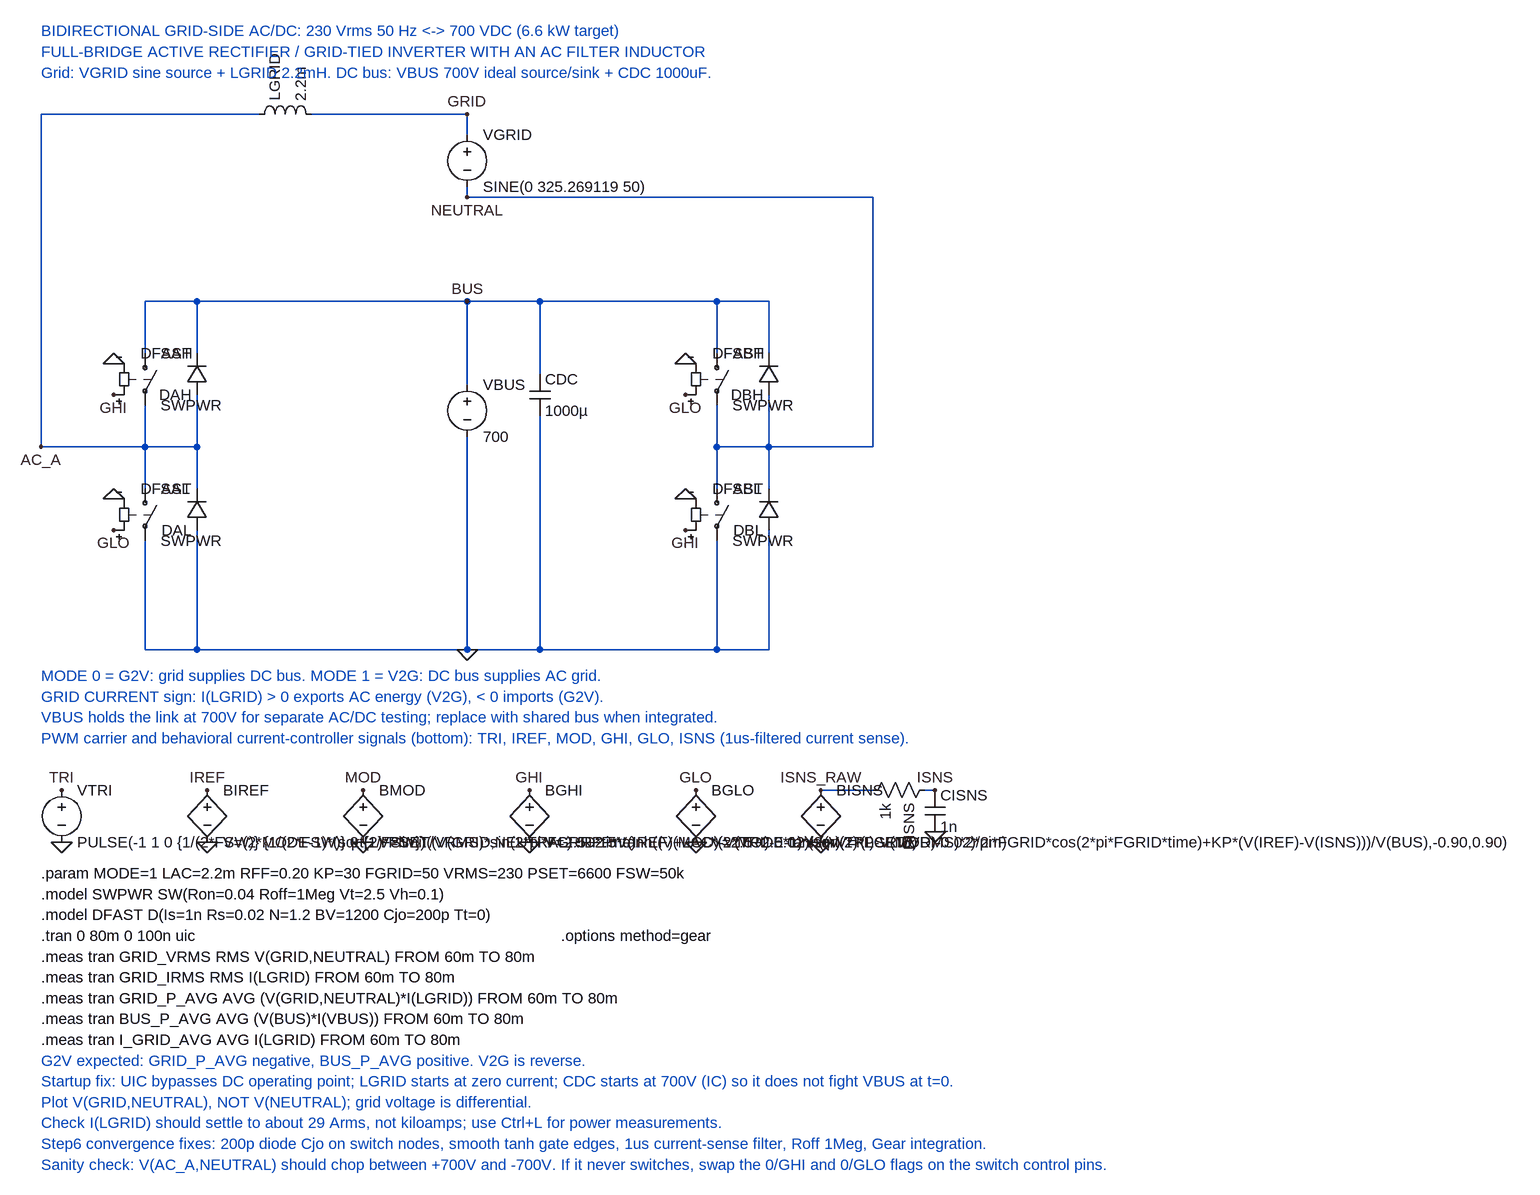
[diagram p0: schematic acdc_grid_stage.asc]
acdc_grid_stage.asc, the LTspice schematic file:
Version 4.1
SHEET 1 2856 2000
WIRE 736 176 400 176
WIRE 1056 176 816 176
WIRE 1056 208 1056 176
WIRE 1056 304 1056 288
WIRE 1680 304 1056 304
WIRE 640 464 560 464
WIRE 1056 464 640 464
WIRE 1168 464 1056 464
WIRE 1440 464 1168 464
WIRE 1520 464 1440 464
WIRE 560 544 560 464
WIRE 640 544 640 464
WIRE 1440 544 1440 464
WIRE 1520 544 1520 464
WIRE 1168 576 1168 464
WIRE 1056 592 1056 464
WIRE 400 688 400 176
WIRE 560 688 560 624
WIRE 560 688 400 688
WIRE 640 688 640 608
WIRE 640 688 560 688
WIRE 1440 688 1440 624
WIRE 1520 688 1520 608
WIRE 1520 688 1440 688
WIRE 1680 688 1680 304
WIRE 1680 688 1520 688
WIRE 560 752 560 688
WIRE 640 752 640 688
WIRE 1440 752 1440 688
WIRE 1520 752 1520 688
WIRE 560 1000 560 832
WIRE 640 1000 640 816
WIRE 640 1000 560 1000
WIRE 1056 1000 1056 672
WIRE 1056 1000 640 1000
WIRE 1168 1000 1168 640
WIRE 1168 1000 1056 1000
WIRE 1440 1000 1440 832
WIRE 1440 1000 1168 1000
WIRE 1520 1000 1520 816
WIRE 1520 1000 1440 1000
WIRE 1680 1216 1600 1216
WIRE 1776 1216 1760 1216
FLAG 1056 464 BUS
FLAG 400 688 AC_A
FLAG 1056 176 GRID
FLAG 1056 304 NEUTRAL
FLAG 1056 1000 0
FLAG 512 560 0
FLAG 512 608 GHI
FLAG 512 768 0
FLAG 512 816 GLO
FLAG 1392 560 0
FLAG 1392 608 GLO
FLAG 1392 768 0
FLAG 1392 816 GHI
FLAG 432 1216 TRI
FLAG 432 1296 0
FLAG 656 1216 IREF
FLAG 656 1296 0
FLAG 896 1216 MOD
FLAG 896 1296 0
FLAG 1152 1216 GHI
FLAG 1152 1296 0
FLAG 1408 1216 GLO
FLAG 1408 1296 0
FLAG 1600 1216 ISNS_RAW
FLAG 1600 1296 0
FLAG 1776 1216 ISNS
FLAG 1776 1280 0
SYMBOL ind 720 192 R270
SYMATTR InstName LGRID
SYMATTR Value 2.2m
SYMATTR SpiceLine Rser=0.12
SYMBOL voltage 1056 192 R0
SYMATTR InstName VGRID
SYMATTR Value SINE(0 325.269119 50)
SYMBOL sw 560 528 R0
SYMATTR InstName SAH
SYMATTR Value SWPWR
SYMBOL sw 560 736 R0
SYMATTR InstName SAL
SYMATTR Value SWPWR
SYMBOL sw 1440 528 R0
SYMATTR InstName SBH
SYMATTR Value SWPWR
SYMBOL sw 1440 736 R0
SYMATTR InstName SBL
SYMATTR Value SWPWR
SYMBOL diode 656 608 R180
SYMATTR InstName DAH
SYMATTR Value DFAST
SYMBOL diode 656 816 R180
SYMATTR InstName DAL
SYMATTR Value DFAST
SYMBOL diode 1536 608 R180
SYMATTR InstName DBH
SYMATTR Value DFAST
SYMBOL diode 1536 816 R180
SYMATTR InstName DBL
SYMATTR Value DFAST
SYMBOL voltage 1056 576 R0
SYMATTR InstName VBUS
SYMATTR Value 700
SYMBOL cap 1152 576 R0
SYMATTR InstName CDC
SYMATTR Value 1000µ
SYMATTR SpiceLine Rser=10m IC=700
SYMBOL voltage 432 1200 R0
SYMATTR InstName VTRI
SYMATTR Value PULSE(-1 1 0 {1/(2*FSW)} {1/(2*FSW)} 0 {1/FSW})
SYMBOL bv 656 1200 R0
SYMATTR InstName BIREF
SYMATTR Value V=(2*MODE-1)*(sqrt(2)*PSET/VRMS)*sin(2*pi*FGRID*time)
SYMBOL bv 896 1200 R0
SYMATTR InstName BMOD
SYMATTR Value V=limit((V(GRID,NEUTRAL)+RFF*V(IREF)+LAC*(2*MODE-1)*(sqrt(2)*PSET/VRMS)*2*pi*FGRID*cos(2*pi*FGRID*time)+KP*(V(IREF)-V(ISNS)))/V(BUS),-0.90,0.90)
SYMBOL bv 1152 1200 R0
SYMATTR InstName BGHI
SYMATTR Value V=2.5+2.5*tanh((V(MOD)-V(TRI)-0.02)/2m)
SYMBOL bv 1408 1200 R0
SYMATTR InstName BGLO
SYMATTR Value V=2.5+2.5*tanh((V(TRI)-V(MOD)-0.02)/2m)
SYMBOL bv 1600 1200 R0
SYMATTR InstName BISNS
SYMATTR Value V=I(LGRID)
SYMBOL res 1776 1200 R90
SYMATTR InstName RISNS
SYMATTR Value 1k
SYMBOL cap 1760 1216 R0
SYMATTR InstName CISNS
SYMATTR Value 1n
TEXT 400 48 Left 2 ;BIDIRECTIONAL GRID-SIDE AC/DC: 230 Vrms 50 Hz <-> 700 VDC (6.6 kW target)
TEXT 400 80 Left 2 ;FULL-BRIDGE ACTIVE RECTIFIER / GRID-TIED INVERTER WITH AN AC FILTER INDUCTOR
TEXT 400 112 Left 2 ;Grid: VGRID sine source + LGRID 2.2mH. DC bus: VBUS 700V ideal source/sink + CDC 1000uF.
TEXT 400 1040 Left 2 ;MODE 0 = G2V: grid supplies DC bus. MODE 1 = V2G: DC bus supplies AC grid.
TEXT 400 1072 Left 2 ;GRID CURRENT sign: I(LGRID) > 0 exports AC energy (V2G), < 0 imports (G2V).
TEXT 400 1104 Left 2 ;VBUS holds the link at 700V for separate AC/DC testing; replace with shared bus when integrated.
TEXT 400 1136 Left 2 ;PWM carrier and behavioral current-controller signals (bottom): TRI, IREF, MOD, GHI, GLO, ISNS (1us-filtered current sense).
TEXT 400 1344 Left 2 !.param MODE=1 LAC=2.2m RFF=0.20 KP=30 FGRID=50 VRMS=230 PSET=6600 FSW=50k
TEXT 400 1376 Left 2 !.model SWPWR SW(Ron=0.04 Roff=1Meg Vt=2.5 Vh=0.1)
TEXT 400 1408 Left 2 !.model DFAST D(Is=1n Rs=0.02 N=1.2 BV=1200 Cjo=200p Tt=0)
TEXT 400 1440 Left 2 !.tran 0 80m 0 100n uic
TEXT 1200 1440 Left 2 !.options method=gear
TEXT 400 1472 Left 2 !.meas tran GRID_VRMS RMS V(GRID,NEUTRAL) FROM 60m TO 80m
TEXT 400 1504 Left 2 !.meas tran GRID_IRMS RMS I(LGRID) FROM 60m TO 80m
TEXT 400 1536 Left 2 !.meas tran GRID_P_AVG AVG (V(GRID,NEUTRAL)*I(LGRID)) FROM 60m TO 80m
TEXT 400 1568 Left 2 !.meas tran BUS_P_AVG AVG (V(BUS)*I(VBUS)) FROM 60m TO 80m
TEXT 400 1600 Left 2 !.meas tran I_GRID_AVG AVG I(LGRID) FROM 60m TO 80m
TEXT 400 1632 Left 2 ;G2V expected: GRID_P_AVG negative, BUS_P_AVG positive. V2G is reverse.
TEXT 400 1664 Left 2 ;Startup fix: UIC bypasses DC operating point; LGRID starts at zero current; CDC starts at 700V (IC) so it does not fight VBUS at t=0.
TEXT 400 1696 Left 2 ;Plot V(GRID,NEUTRAL), NOT V(NEUTRAL); grid voltage is differential.
TEXT 400 1728 Left 2 ;Check I(LGRID) should settle to about 29 Arms, not kiloamps; use Ctrl+L for power measurements.
TEXT 400 1760 Left 2 ;Step6 convergence fixes: 200p diode Cjo on switch nodes, smooth tanh gate edges, 1us current-sense filter, Roff 1Meg, Gear integration.
TEXT 400 1792 Left 2 ;Sanity check: V(AC_A,NEUTRAL) should chop between +700V and -700V. If it never switches, swap the 0/GHI and 0/GLO flags on the switch control pins.

The netlist it stands for:
* acdc_grid_stage.asc
LGRID AC_A GRID 2.2m Rser=0.12
VGRID GRID NEUTRAL SINE(0 325.269119 50)
SAH BUS AC_A GHI 0 SWPWR
SAL AC_A 0 GLO 0 SWPWR
SBH BUS NEUTRAL GLO 0 SWPWR
SBL NEUTRAL 0 GHI 0 SWPWR
DAH AC_A BUS DFAST
DAL 0 AC_A DFAST
DBH NEUTRAL BUS DFAST
DBL 0 NEUTRAL DFAST
VBUS BUS 0 700
CDC BUS 0 1000µ Rser=10m IC=700
VTRI TRI 0 PULSE(-1 1 0 {1/(2*FSW)} {1/(2*FSW)} 0 {1/FSW})
BIREF IREF 0 V=(2*MODE-1)*(sqrt(2)*PSET/VRMS)*sin(2*pi*FGRID*time)
BMOD MOD 0 V=limit((V(GRID,NEUTRAL)+RFF*V(IREF)+LAC*(2*MODE-1)*(sqrt(2)*PSET/VRMS)*2*pi*FGRID*cos(2*pi*FGRID*time)+KP*(V(IREF)-V(ISNS)))/V(BUS),-0.90,0.90)
BGHI GHI 0 V=2.5+2.5*tanh((V(MOD)-V(TRI)-0.02)/2m)
BGLO GLO 0 V=2.5+2.5*tanh((V(TRI)-V(MOD)-0.02)/2m)
BISNS ISNS_RAW 0 V=I(LGRID)
RISNS ISNS ISNS_RAW 1k
CISNS ISNS 0 1n
.model D D
.lib standard.dio
* BIDIRECTIONAL GRID-SIDE AC/DC: 230 Vrms 50 Hz <-> 700 VDC (6.6 kW target)
* FULL-BRIDGE ACTIVE RECTIFIER / GRID-TIED INVERTER WITH AN AC FILTER INDUCTOR
* Grid: VGRID sine source + LGRID 2.2mH. DC bus: VBUS 700V ideal source/sink + CDC 1000uF.
* MODE 0 = G2V: grid supplies DC bus. MODE 1 = V2G: DC bus supplies AC grid.
* GRID CURRENT sign: I(LGRID) > 0 exports AC energy (V2G), < 0 imports (G2V).
* VBUS holds the link at 700V for separate AC/DC testing; replace with shared bus when integrated.
* PWM carrier and behavioral current-controller signals (bottom): TRI, IREF, MOD, GHI, GLO, ISNS (1us-filtered current sense).
.param MODE=1 LAC=2.2m RFF=0.20 KP=30 FGRID=50 VRMS=230 PSET=6600 FSW=50k
.model SWPWR SW(Ron=0.04 Roff=1Meg Vt=2.5 Vh=0.1)
.model DFAST D(Is=1n Rs=0.02 N=1.2 BV=1200 Cjo=200p Tt=0)
.tran 0 80m 0 100n uic
.options method=gear
.meas tran GRID_VRMS RMS V(GRID,NEUTRAL) FROM 60m TO 80m
.meas tran GRID_IRMS RMS I(LGRID) FROM 60m TO 80m
.meas tran GRID_P_AVG AVG (V(GRID,NEUTRAL)*I(LGRID)) FROM 60m TO 80m
.meas tran BUS_P_AVG AVG (V(BUS)*I(VBUS)) FROM 60m TO 80m
.meas tran I_GRID_AVG AVG I(LGRID) FROM 60m TO 80m
* G2V expected: GRID_P_AVG negative, BUS_P_AVG positive. V2G is reverse.
* Startup fix: UIC bypasses DC operating point; LGRID starts at zero current; CDC starts at 700V (IC) so it does not fight VBUS at t=0.
* Plot V(GRID,NEUTRAL), NOT V(NEUTRAL); grid voltage is differential.
* Check I(LGRID) should settle to about 29 Arms, not kiloamps; use Ctrl+L for power measurements.
* Step6 convergence fixes: 200p diode Cjo on switch nodes, smooth tanh gate edges, 1us current-sense filter, Roff 1Meg, Gear integration.
* Sanity check: V(AC_A,NEUTRAL) should chop between +700V and -700V. If it never switches, swap the 0/GHI and 0/GLO flags on the switch control pins.
.backanno
.end